# EAGLE design blinky (EAGLE 9.6.2)
Synthetic 555 blinker (test data)

## Sheet 1 of 2: Timer
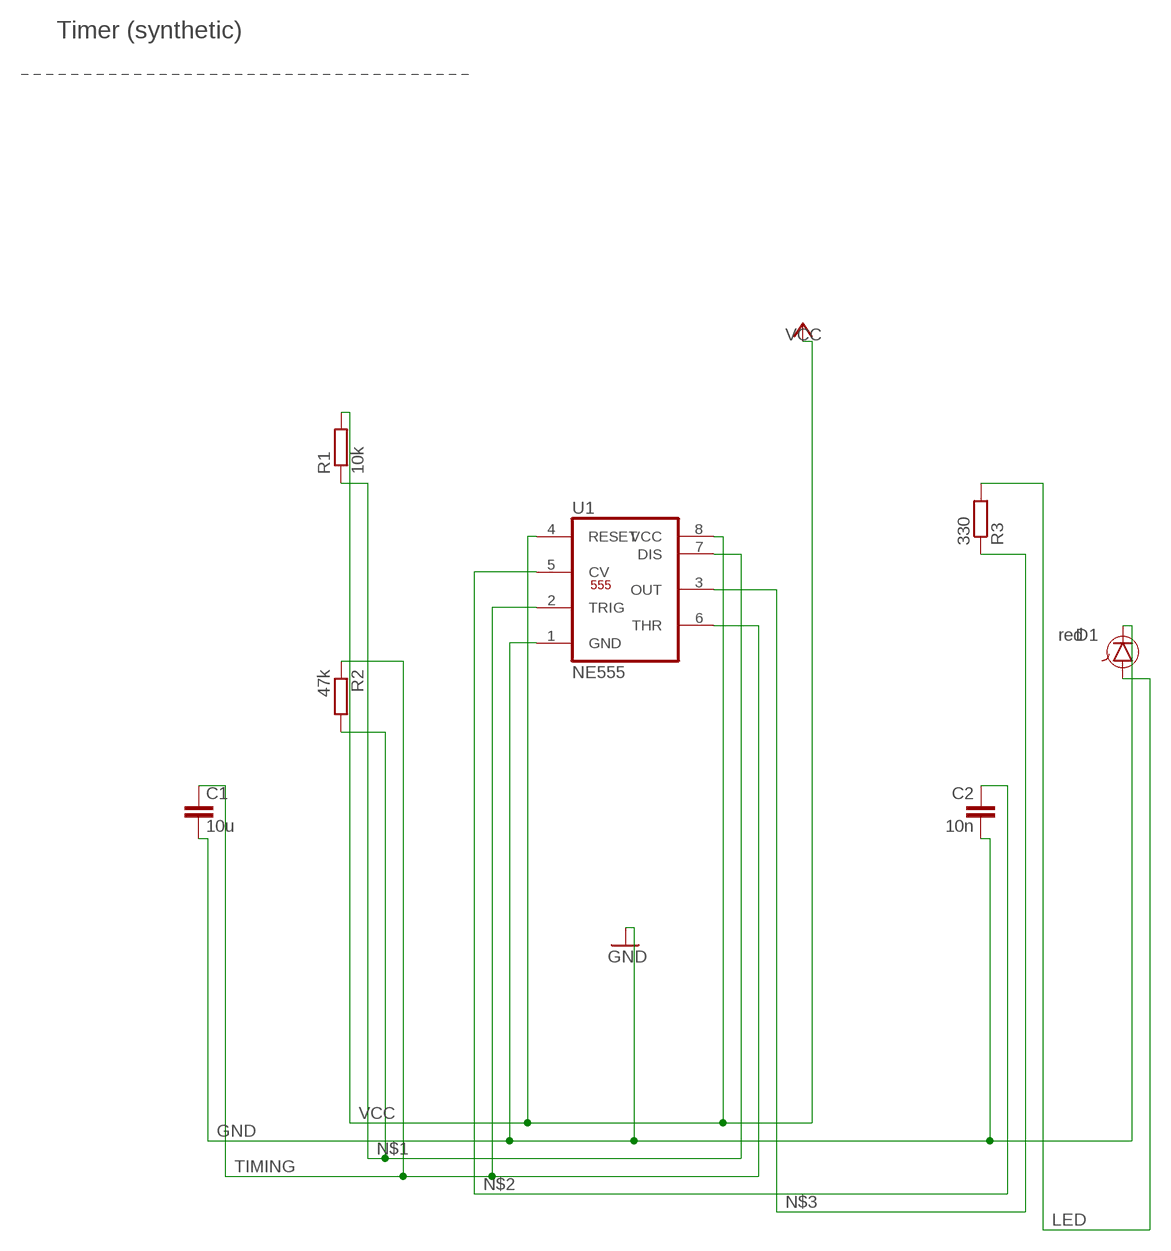
[diagram p0: schematic, sheet 1]

### Parts
C1  10u  C0603  [C0603]
C2  10n  C0603  [C0603]
D1  red  LED  [LED3MM]
R1  10k  R0805  [R0805]
R2  47k  R0805  [R0805]
R3  330  R0805  [R0805]
U1  NE555  NE555D  [SO08]

### Nets
GND [power]: C1.2 C2.2 D1.C U1.1(GND) ; also sheet 2
LED: D1.A R3.2
N$1: R1.1 R2.2 U1.7(DIS)
N$2: C2.1 U1.5(CV)
N$3: R3.1 U1.3(OUT)
TIMING: C1.1 R2.1 U1.2(TRIG) U1.6(THR)
VCC [power]: R1.2 U1.4(RESET) U1.8(VCC) ; also sheet 2

### Notes on the sheet
- Timer (synthetic)

## Sheet 2 of 2: Power input
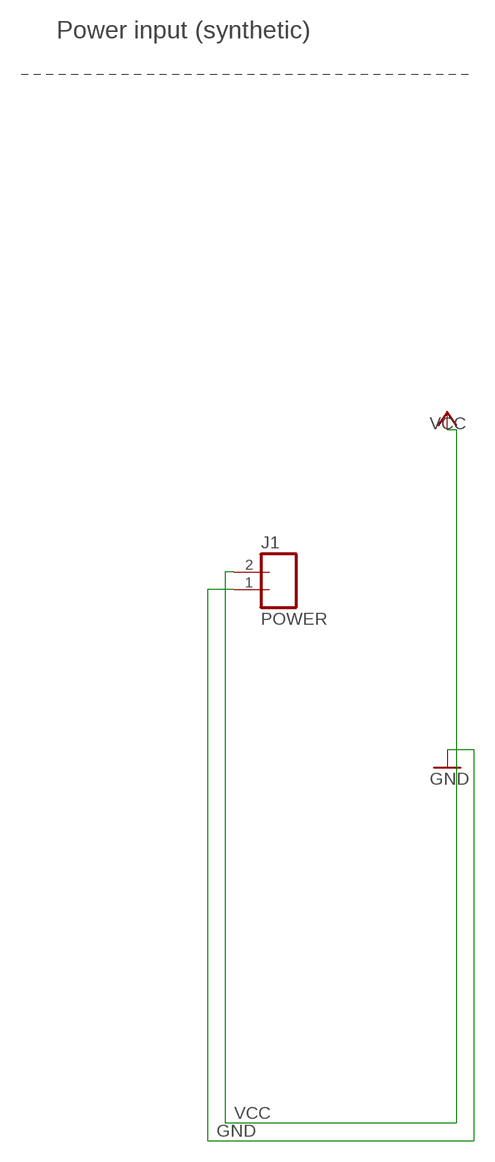
[diagram p1: schematic, sheet 2]

### Parts
J1  POWER  CONN2  [HDR2]

### Nets
GND [power]: J1.1 ; also sheet 1
VCC [power]: J1.2 ; also sheet 1

### Notes on the sheet
- Power input (synthetic)

## Library data of the parts
C1 C2 = blinky:C: Capacitor
D1 = blinky:LED: Red LED, 3 mm
J1 = blinky:CONN2: Two pins
R1-R3 = blinky:R: Resistor
U1 = blinky:NE555: Timer; MPN: NE555DR

## Net classes
0 default: width 0.254 mm, drill 0.3 mm
1 power: width 0.5 mm, drill 0.4 mm

## Board
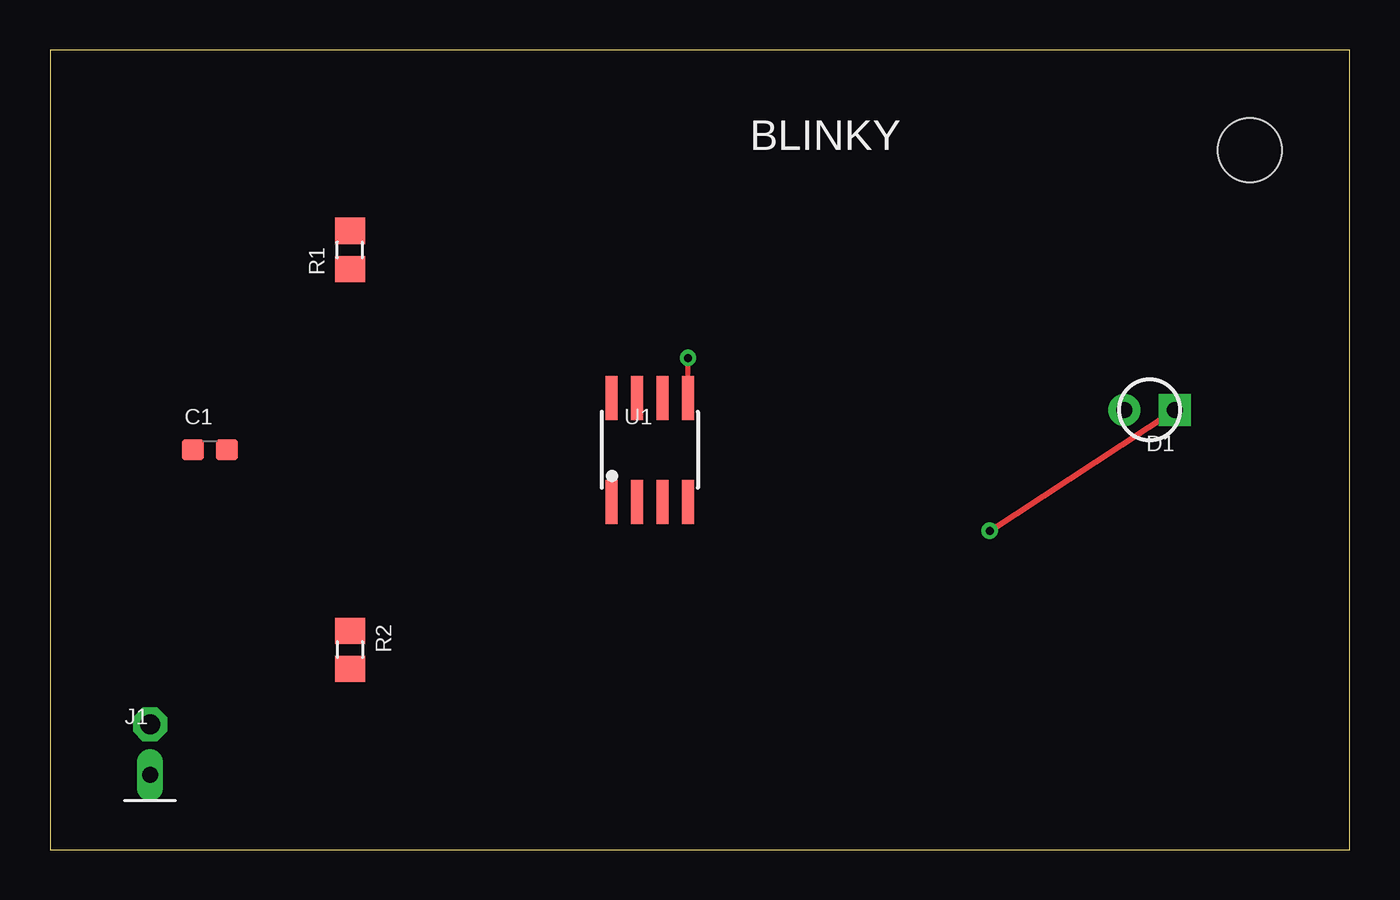
[diagram p2: board, top side]
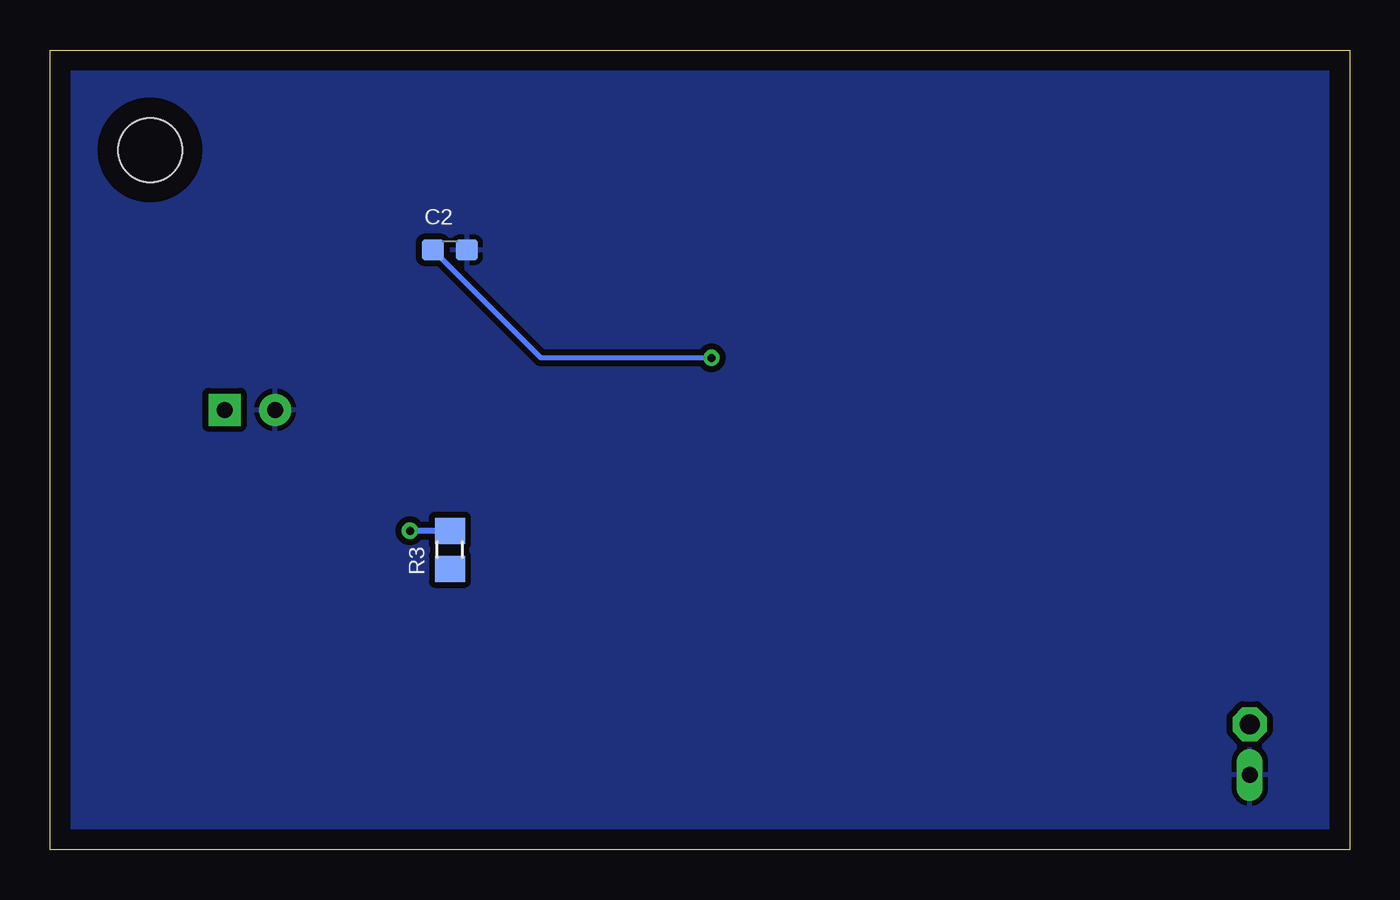
[diagram p3: board, bottom side, seen from below]

Size 65 x 40 mm. Coordinates in mm from the lower left corner, seen from the top.
Outline: 0,0 65,0 65,40 0,40 0,0
Copper layers (1*16): Top / Bottom
Design rules "default": minimum track width 6mil, minimum drill 0.3mm, track to track 8mil
Holes 3.2 mm at 60,35

### Footprints (pad centres in the part's own frame; a part is rotated, then mirrored left to right if it is on the bottom)
C0603 = smd 1.1 x 1: 1 -0.85,0; 2 0.85,0
LED3MM = drill 0.8 pad 1.6 square: A -1.27,0 | drill 0.8 pad 1.6: C 1.27,0
HDR2 = drill 0.8 pad 1.2 long: 1 0,-1.27 | drill 1 pad 1.7 octagon: 2 0,1.27
R0805 = smd 1.3 x 1.5: 1 -0.95,0; 2 0.95,0
SO08 = smd 0.6 x 2.2: 1 -1.905,-2.6; 2 -0.635,-2.6; 3 0.635,-2.6; 4 1.905,-2.6; 5 1.905,2.6; 6 0.635,2.6; 7 -0.635,2.6; 8 -1.905,2.6

### Placement (x,y rotation side)
C1  8,20 0 top
C2  45,30 0 bottom
D1  55,22 180 top
J1  5,5 0 top
R1  15,30 90 top
R2  15,10 270 top
R3  45,15 90 bottom
U1  30,20 0 top

### Tracks (layer width: path | path; a pad name or v marks a point on that pad's centre or on a via)
GND
  pour Bottom (isolate 0.3): 1,1 64,1 64,39 1,39
LED  (via drill 0.4 pad 0.8)
  Top 0.3: v47,15.95 D1.A
  Bottom 0.3: R3.2 v47,15.95
N$2  (via drill 0.4 pad 0.8)
  Top 0.254: U1.5 v31.91,24.6
  Bottom 0.254: v31.91,24.6 40.45,24.6 C2.1

### Text on the board
tPlace: BLINKY